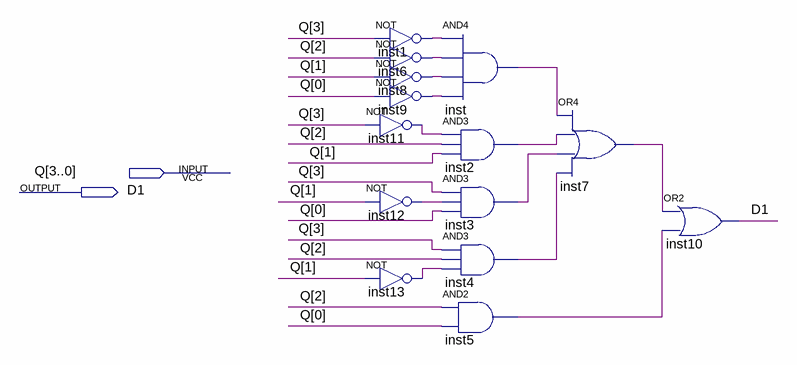
[diagram p0: schematic sheet]
// Quartus schematic d1_logic.bdf as structural Verilog: 14 symbols, 2 pins
module d1_logic (
  input  [3:0] Q,
  output D1
);

  wire inst1_out, inst2_out, inst3_out, inst4_out, inst5_out, inst6_out, inst7_out, inst8_out, inst9_out,
       inst11_out, inst12_out, inst13_out, inst_out;

  not inst1 (inst1_out, Q[3]);
  not inst6 (inst6_out, Q[2]);
  not inst8 (inst8_out, Q[1]);
  not inst9 (inst9_out, Q[0]);
  not inst11 (inst11_out, Q[3]);
  not inst12 (inst12_out, Q[1]);
  not inst13 (inst13_out, Q[1]);
  and inst (inst_out, inst1_out, inst6_out, inst8_out, inst9_out);
  and inst2 (inst2_out, inst11_out, Q[2], Q[1]);
  and inst3 (inst3_out, Q[3], inst12_out, Q[0]);
  and inst4 (inst4_out, Q[3], Q[2], inst13_out);
  and inst5 (inst5_out, Q[2], Q[0]);
  or inst7 (inst7_out, inst_out, inst2_out, inst3_out, inst4_out);
  or inst10 (D1, inst7_out, inst5_out);
endmodule
